# Altium schematic sheet Transform_310_310.SchDoc
size C; SheetNumber: 5; SheetTotal: 9
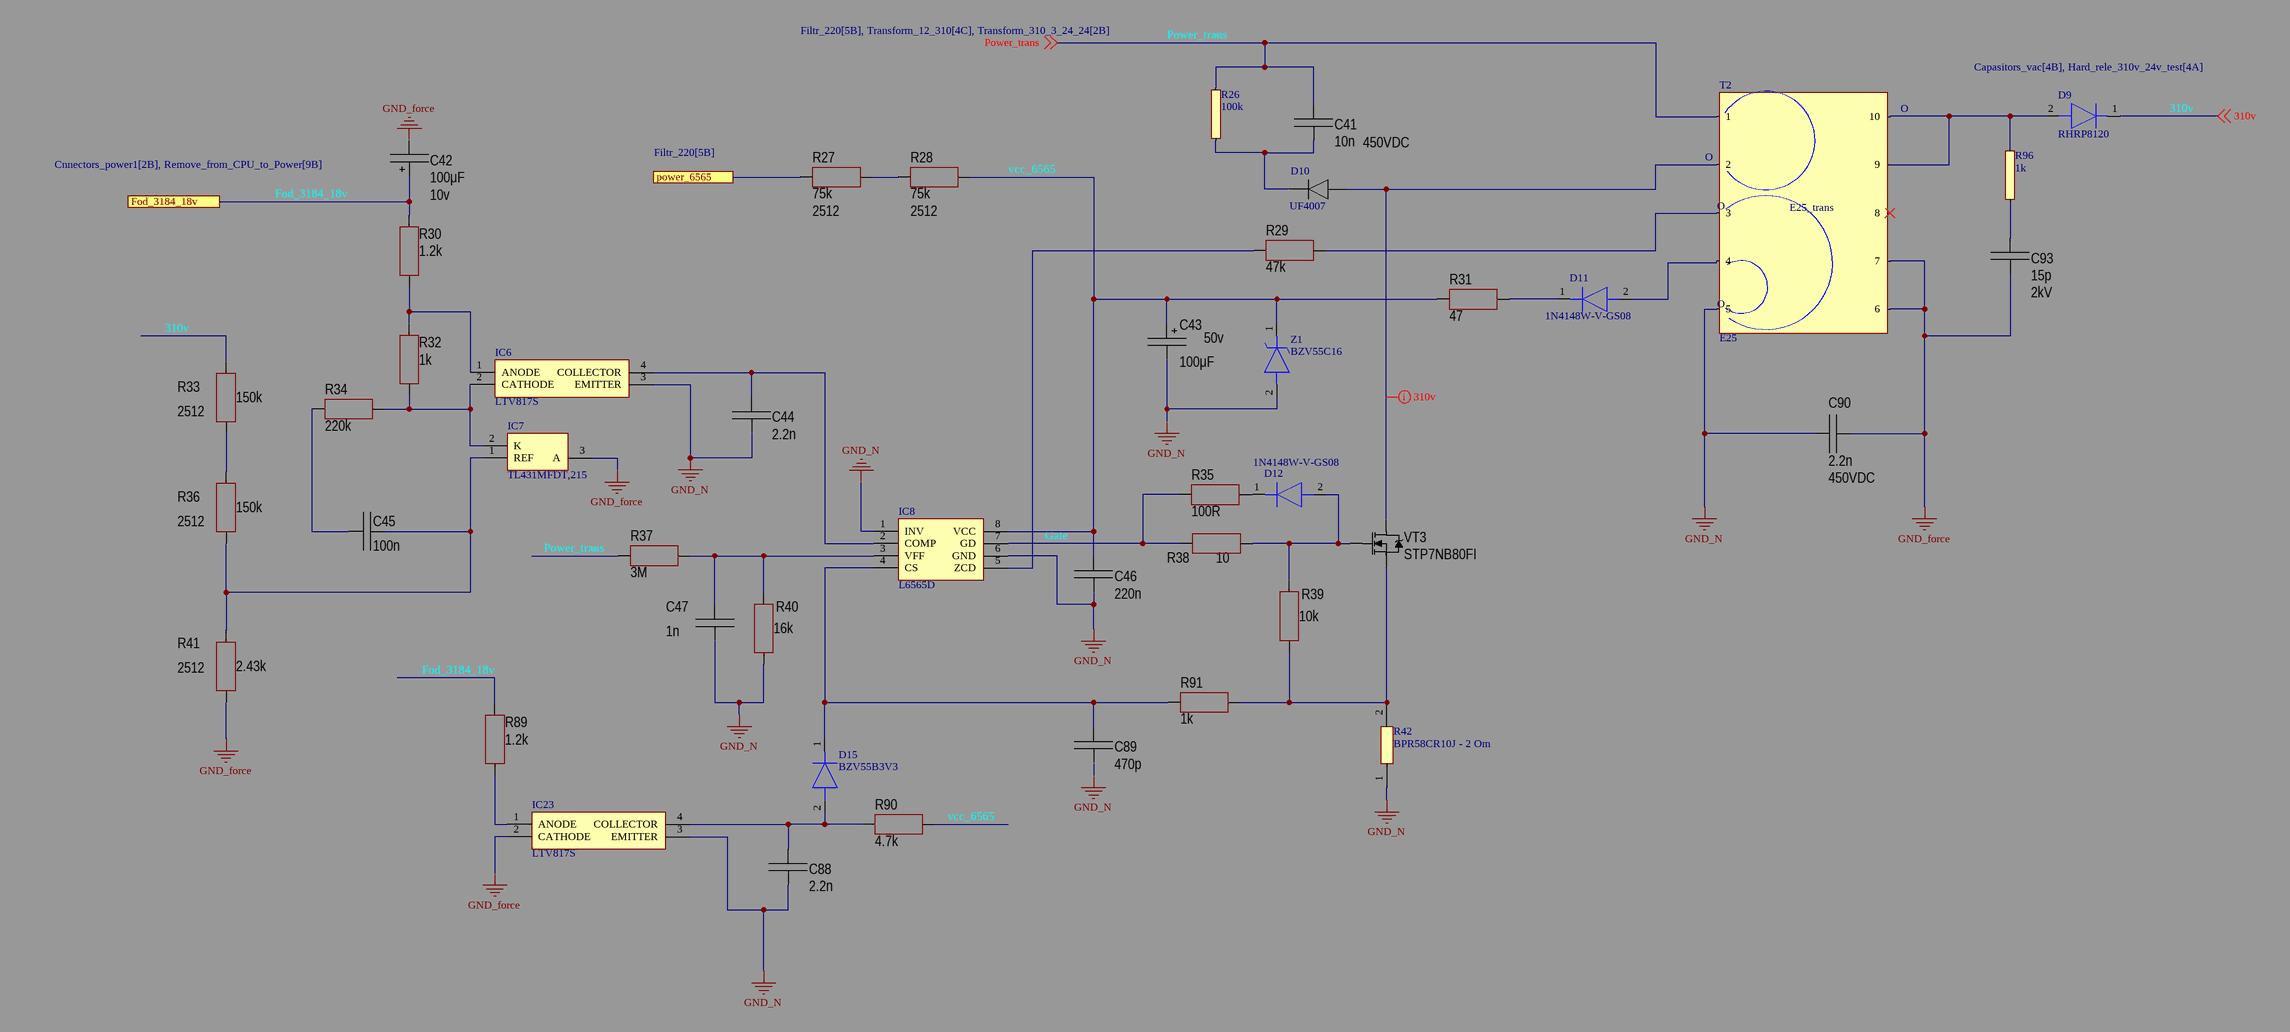
[diagram p0: Transform_310_310.SchDoc]

## Parts
C41  value 10n  Voltage: 450VDC  [CAP: AY2102M29Y5US63L7]
C42  value 100μF  Voltage: 10v  [CAP: D8C3.5H12]
C43  value 100μF  Voltage: 50v  [CAP: D8C3.5H12]
C44  value 2.2n  [CAP: 1206]
C45  value 100n  [CAP: 1206]
C46  value 220n  [CAP: 1206]
C47  value 1n  [CAP: 1206]
C88  value 2.2n  [CAP: 1206]
C89  value 470p  [CAP: 1206]
C90  value 2.2n  Voltage: 450VDC  [CAP: AY2102M29Y5US63L7]
C93  value 15p  Voltage: 2kV  [CAP: AY2102M29Y5US63L7]
D9  RHRP8120  [TO508P467X1023X1923-2P]
D10  UF4007  [THT_D_6mm_1]
D11  1N4148W-V-GS08  [1N4148WVGS08]
D12  1N4148W-V-GS08  [1N4148WVGS08]
D15  BZV55B3V3  [BZV55B3V3]
IC6  LTV817S  [SOP254P1016X460-4N]
IC7  TL431MFDT,215  [SOT95P230X110-3N]
IC8  L6565D  [SOIC127P600X175-8N]
IC23  LTV817S  [SOP254P1016X460-4N]
R26  100k  [THT_R_6mm_1]
R27  value 75k  Tolerance: 2512  [RES: 2512]
R28  value 75k  Tolerance: 2512  [RES: 2512]
R29  value 47k  [RES: 1206]
R30  value 1.2k  [RES: 1206]
R31  value 47  [RES: 1206]
R32  value 1k  [RES: 1206]
R33  value 150k  Tolerance: 2512  [RES: 2512]
R34  value 220k  [RES: 1206]
R35  value 100R  [RES: 1206]
R36  value 150k  Tolerance: 2512  [RES: 2512]
R37  value 3M  [RES: 1206]
R38  value 10  [RES: 1206]
R39  value 10k  [RES: 1206]
R40  value 16k  [RES: 1206]
R41  value 2.43k  Tolerance: 2512  [RES: 2512]
R42  BPR58CR10J - 2 Om  [BPR58CR10J]
R89  value 1.2k  [RES: 1206]
R90  value 4.7k  [RES: 1206]
R91  value 1k  [RES: 1206]
R96  1k  [THT_R_6mm_1]
T2  E25  [E25]
VT3  PartNumber: STP7NB80FI  [TO220]
Z1  BZV55C16  [BZV55C18]

## Ports
Fod_3184_18v (see Cnnectors_power1[2B], Remove_from_CPU_to_Power[9B]), power_6565 (see Filtr_220[5B])

## Nets
GND_force: C42.2 C90.2 C93.1 IC7.3(A) IC23.2(CATHODE) R41.1 T2.6 T2.7
GND_N: C43.2 C44.2 C46.1 C47.2 C88.2 C89.2 C90.1 IC6.3(EMITTER) IC8.1(INV) IC8.6(GND) IC23.3(EMITTER) R40.1 R42.1 T2.5 Z1.2(A)
310v: D9.1(K) R33.2 ; off-sheet 310v
Fod_3184_18v: C42.1 R30.1 R89.1 ; port Fod_3184_18v
Gate: IC8.7(GD) R35.1 R38.1
power_6565: R27.1 ; port power_6565
Power_trans: C41.1 R26.2 R37.1 T2.1 ; off-sheet Power_trans
vcc_6565: C43.1 C46.2 IC8.8(VCC) R28.2 R31.1 R90.2 Z1.1(K)
NetC41_2: C41.2 D10.2 R26.1
NetC44_1: C44.1 IC6.4(COLLECTOR) IC8.2(COMP)
NetC45_1: C45.1 IC7.1(REF) R36.1 R41.2
NetC45_2: C45.2 R34.1
NetC47_1: C47.1 IC8.3(VFF) R37.2 R40.2
NetC88_1: C88.1 D15.2(A) IC23.4(COLLECTOR) R90.1
NetC89_1: C89.1 D15.1(K) IC8.4(CS) R91.1
NetC93_2: C93.2 R96.1
NetD9_2: D9.2(A) R96.2 T2.9 T2.10
NetD10_1: D10.1 T2.2 VT3.2(D)
NetD11_1: D11.1(K) R31.2
NetD11_2: D11.2(A) T2.4
NetD12_1: D12.1(K) R35.2
NetD12_2: D12.2(A) R38.2 R39.2 VT3.1(G)
NetIC6_1: IC6.1(ANODE) R30.2 R32.2
NetIC6_2: IC6.2(CATHODE) IC7.2(K) R32.1 R34.2
NetIC8_5: IC8.5(ZCD) R29.1
NetIC23_1: IC23.1(ANODE) R89.2
NetR27_2: R27.2 R28.1
NetR29_2: R29.2 T2.3
NetR33_1: R33.1 R36.2
NetR39_1: R39.1 R42.2 R91.2 VT3.3(S)

Not connected (* = marked no-connect by the designer): T2 8*

## Layout directives
net class 310v: NetD10_1

## Notes on the sheet
- (near T2) O
- (in symbol E25) E25_trans

## Library data of the parts
C41 = Film: Manufacturer: Epcos; PartNumber: B32774D4106K000; ValueManufacturerPartNumber: Film capacitor, 10n, 450VDC, ±10%, 10.9mOhm, 31.5x15 mm, -40...+105°C; TypeCapacitor: Film capacitor; Tolerance: ±10%; Impedance: 10.9mOhm; Package: 31.5x15 mm; HelpURL: https://www.digikey.com/products/en/capacitors/film-capacitors/62?k=&pkeyword=&sv=0&pv2097=1958&sf=0&FV=fffc01ef%2C1f140000%2Cffe0003e%2Cffec6366&quantity=1&ColumnSort=1000011&page=1&stock=1&pageSize=25; Temperature: -40...+105°C
C42 = Aluminium: Manufacturer: Wurth; PartNumber: 860080475013; ValueManufacturerPartNumber: Aluminium capacitor, 100μF, 10v, ±20%, 54mOhm, 14x10x5 mm, -55...+105°C; TypeCapacitor: Aluminium capacitor; Tolerance: ±20%; Impedance: 54mOhm; Package: 14x10x5 mm; HelpURL: https://www.digikey.com/product-detail/en/wurth-electronics-inc/860080475013/732-9029-1-ND/5728972; Temperature: -55...+105°C
C43 = Aluminium: Manufacturer: Wurth; PartNumber: 860080475013; ValueManufacturerPartNumber: Aluminium capacitor, 100μF, 50v, ±20%, 54mOhm, 14x10x5 mm, -55...+105°C; TypeCapacitor: Aluminium capacitor; Tolerance: ±20%; Impedance: 54mOhm; Package: 14x10x5 mm; HelpURL: https://www.digikey.com/product-detail/en/wurth-electronics-inc/860080475013/732-9029-1-ND/5728972; Temperature: -55...+105°C
C44 C88 = Ceramic_1206: Manufacturer: Yageo; PartNumber: CC1206KRX7R9BB104; ValueManufacturerPartNumber: Ceramic capacitor, 2.2n, X7R, ±10%, 50V, 1206, -55...+125°C; TypeCapacitor: Ceramic capacitor; Tolerance: ±10%; TypeDielectric: X7R; Voltage: 50V; Package: 1206; HelpURL: https://www.digikey.com/product-detail/en/yageo/CC1206KRX7R9BB104/311-1179-1-ND/303089; Temperature: -55...+125°C
C45 = Ceramic_1206: Manufacturer: Yageo; PartNumber: CC1206KRX7R9BB104; ValueManufacturerPartNumber: Ceramic capacitor, 100n, X7R, ±10%, 50V, 1206, -55...+125°C; TypeCapacitor: Ceramic capacitor; Tolerance: ±10%; TypeDielectric: X7R; Voltage: 50V; Package: 1206; HelpURL: https://www.digikey.com/product-detail/en/yageo/CC1206KRX7R9BB104/311-1179-1-ND/303089; Temperature: -55...+125°C
C46 = Ceramic_1206: Manufacturer: Yageo; PartNumber: CC1206KRX7R9BB104; ValueManufacturerPartNumber: Ceramic capacitor, 220n, X7R, ±10%, 50V, 1206, -55...+125°C; TypeCapacitor: Ceramic capacitor; Tolerance: ±10%; TypeDielectric: X7R; Voltage: 50V; Package: 1206; HelpURL: https://www.digikey.com/product-detail/en/yageo/CC1206KRX7R9BB104/311-1179-1-ND/303089; Temperature: -55...+125°C
C47 = Ceramic_1206: Manufacturer: Yageo; PartNumber: CC1206KRX7R9BB104; ValueManufacturerPartNumber: Ceramic capacitor, 1n, X7R, ±10%, 50V, 1206, -55...+125°C; TypeCapacitor: Ceramic capacitor; Tolerance: ±10%; TypeDielectric: X7R; Voltage: 50V; Package: 1206; HelpURL: https://www.digikey.com/product-detail/en/yageo/CC1206KRX7R9BB104/311-1179-1-ND/303089; Temperature: -55...+125°C
C89 = Ceramic_1206: Manufacturer: Yageo; PartNumber: CC1206KRX7R9BB104; ValueManufacturerPartNumber: Ceramic capacitor, 470p, X7R, ±10%, 50V, 1206, -55...+125°C; TypeCapacitor: Ceramic capacitor; Tolerance: ±10%; TypeDielectric: X7R; Voltage: 50V; Package: 1206; HelpURL: https://www.digikey.com/product-detail/en/yageo/CC1206KRX7R9BB104/311-1179-1-ND/303089; Temperature: -55...+125°C
C90 = Film: Manufacturer: Epcos; PartNumber: B32774D4106K000; ValueManufacturerPartNumber: Film capacitor, 2.2n, 450VDC, ±10%, 10.9mOhm, 31.5x15 mm, -40...+105°C; TypeCapacitor: Film capacitor; Tolerance: ±10%; Impedance: 10.9mOhm; Package: 31.5x15 mm; HelpURL: https://www.digikey.com/products/en/capacitors/film-capacitors/62?k=&pkeyword=&sv=0&pv2097=1958&sf=0&FV=fffc01ef%2C1f140000%2Cffe0003e%2Cffec6366&quantity=1&ColumnSort=1000011&page=1&stock=1&pageSize=25; Temperature: -40...+105°C
C93 = Film: Manufacturer: Epcos; PartNumber: B32774D4106K000; ValueManufacturerPartNumber: Film capacitor, 15p, 2kV, ±10%, 10.9mOhm, 31.5x15 mm, -40...+105°C; TypeCapacitor: Film capacitor; Tolerance: ±10%; Impedance: 10.9mOhm; Package: 31.5x15 mm; HelpURL: https://www.digikey.com/products/en/capacitors/film-capacitors/62?k=&pkeyword=&sv=0&pv2097=1958&sf=0&FV=fffc01ef%2C1f140000%2Cffe0003e%2Cffec6366&quantity=1&ColumnSort=1000011&page=1&stock=1&pageSize=25; Temperature: -40...+105°C
D9 = RHRP8120: Diode; Manufacturer_Name: onsemi; Datasheet Link: https://www.onsemi.com/pub/Collateral/RHRP8120-D.PDF; Height: 4.672mm; Manufacturer_Part_Number: RHRP8120; Mouser Part Number: 512-RHRP8120; Mouser Price/Stock: https://www.mouser.co.uk/ProductDetail/onsemi-Fairchild/RHRP8120?qs=UeXq8qLVREGknIOnwE%2FlEA%3D%3D; Arrow Part Number: RHRP8120; Arrow Price/Stock: https://www.arrow.com/en/products/rhrp8120/on-semiconductor
D10 = THT_D_6mm_1
D11 D12 = 1N4148W-V-GS08: Diode; Manufacturer_Name: Vishay; Datasheet Link: https://us.rs-online.com/m/d/a2789c8794cb0c42ced29f2dd8571f3c.pdf; Height: 1.35mm; Manufacturer_Part_Number: 1N4148W-V-GS08; Mouser Part Number: 625-1N4148W-V; Mouser Price/Stock: https://www.mouser.co.uk/ProductDetail/Vishay-Semiconductors/1N4148W-V-GS08?qs=TNTIDjy6APrS%2Fdgq1RSs3A%3D%3D; Arrow Part Number: 1N4148W-V-GS08; Arrow Price/Stock: https://www.arrow.com/en/products/1n4148w-v-gs08/vishay
D15 = BZV55B3V3: Diode; Manufacturer_Name: Nexperia; Datasheet Link: https://assets.nexperia.com/documents/data-sheet/BZV55_SER.pdf; Height: 1.6mm; Manufacturer_Part_Number: BZV55B3V3
IC6 IC23 = LTV817S: Integrated Circuit; Manufacturer_Name: Lite-On; Datasheet Link: https://www.arrow.com/en/products/ltv-817s/lite-on-technology; Height: 4.6mm; Manufacturer_Part_Number: LTV817S; Arrow Part Number: LTV817S; Arrow Price/Stock: https://www.arrow.com/en/products/ltv-817s/lite-on-technology
IC7 = TL431MFDT,215: Integrated Circuit; Manufacturer_Name: Nexperia; Datasheet Link: https://assets.nexperia.com/documents/data-sheet/TL431_FAM.pdf; Height: 1.1mm; Manufacturer_Part_Number: TL431MFDT,215; Mouser Part Number: 771-TL431MFDT215; Mouser Price/Stock: https://www.mouser.co.uk/ProductDetail/Nexperia/TL431MFDT215?qs=A1cBxND5mHKvFzVl3lBdcQ%3D%3D; Arrow Part Number: TL431MFDT,215; Arrow Price/Stock: https://www.arrow.com/en/products/tl431mfdt215/nexperia?utm_currency=USD&region=nac
IC8 = L6565D: Integrated Circuit; Manufacturer_Name: STMicroelectronics; Datasheet Link: https://www.st.com/resource/en/datasheet/l6565.pdf; Height: 1.75mm; Manufacturer_Part_Number: L6565D; Mouser Part Number: 511-L6565D; Mouser Price/Stock: https://www.mouser.co.uk/ProductDetail/STMicroelectronics/L6565D/?qs=sps7W%2FwBcGGH47tz0cin9g%3D%3D; Arrow Part Number: L6565D; Arrow Price/Stock: https://www.arrow.com/en/products/l6565d/stmicroelectronics
R26 R96 = THT_R_6mm_1
R27 R28 = Resistor_2512: Manufacturer: Yageo; PartNumber: RC2512JK-07100RL; ValueManufacturerPartNumber: Resistor film, 75k, 2512, 2512, 1W, -55...+125°C; TypeResistor: Resistor film; Power: 1W; Package: 2512; HelpURL: https://www.digikey.com/product-detail/en/yageo/RC2512JK-07100RL/YAG3393CT-ND/5962215; Temperature: -55...+125°C
R29 = Resistor_1206: Manufacturer: Yageo; PartNumber: RC1206JR-07100RL; ValueManufacturerPartNumber: Resistor film, 47k, ±5%, 1206, 0.25W, -55...+125°C; TypeResistor: Resistor film; Power: 0.25W; Tolerance: ±5%; Package: 1206; HelpURL: https://www.digikey.com/product-detail/en/yageo/RC1206JR-07100RL/311-100ERCT-ND/732153; Temperature: -55...+125°C
R30 R89 = Resistor_1206: Manufacturer: Yageo; PartNumber: RC1206JR-07100RL; ValueManufacturerPartNumber: Resistor film, 1.2k, ±5%, 1206, 0.25W, -55...+125°C; TypeResistor: Resistor film; Power: 0.25W; Tolerance: ±5%; Package: 1206; HelpURL: https://www.digikey.com/product-detail/en/yageo/RC1206JR-07100RL/311-100ERCT-ND/732153; Temperature: -55...+125°C
R31 = Resistor_1206: Manufacturer: Yageo; PartNumber: RC1206JR-07100RL; ValueManufacturerPartNumber: Resistor film, 47, ±5%, 1206, 0.25W, -55...+125°C; TypeResistor: Resistor film; Power: 0.25W; Tolerance: ±5%; Package: 1206; HelpURL: https://www.digikey.com/product-detail/en/yageo/RC1206JR-07100RL/311-100ERCT-ND/732153; Temperature: -55...+125°C
R32 R91 = Resistor_1206: Manufacturer: Yageo; PartNumber: RC1206JR-07100RL; ValueManufacturerPartNumber: Resistor film, 1k, ±5%, 1206, 0.25W, -55...+125°C; TypeResistor: Resistor film; Power: 0.25W; Tolerance: ±5%; Package: 1206; HelpURL: https://www.digikey.com/product-detail/en/yageo/RC1206JR-07100RL/311-100ERCT-ND/732153; Temperature: -55...+125°C
R33 R36 = Resistor_2512: Manufacturer: Yageo; PartNumber: RC2512JK-07100RL; ValueManufacturerPartNumber: Resistor film, 150k, 2512, 2512, 1W, -55...+125°C; TypeResistor: Resistor film; Power: 1W; Package: 2512; HelpURL: https://www.digikey.com/product-detail/en/yageo/RC2512JK-07100RL/YAG3393CT-ND/5962215; Temperature: -55...+125°C
R34 = Resistor_1206: Manufacturer: Yageo; PartNumber: RC1206JR-07100RL; ValueManufacturerPartNumber: Resistor film, 220k, ±5%, 1206, 0.25W, -55...+125°C; TypeResistor: Resistor film; Power: 0.25W; Tolerance: ±5%; Package: 1206; HelpURL: https://www.digikey.com/product-detail/en/yageo/RC1206JR-07100RL/311-100ERCT-ND/732153; Temperature: -55...+125°C
R35 = Resistor_1206: Manufacturer: Yageo; PartNumber: RC1206JR-07100RL; ValueManufacturerPartNumber: Resistor film, 100R, ±5%, 1206, 0.25W, -55...+125°C; TypeResistor: Resistor film; Power: 0.25W; Tolerance: ±5%; Package: 1206; HelpURL: https://www.digikey.com/product-detail/en/yageo/RC1206JR-07100RL/311-100ERCT-ND/732153; Temperature: -55...+125°C
R37 = Resistor_1206: Manufacturer: Yageo; PartNumber: RC1206JR-07100RL; ValueManufacturerPartNumber: Resistor film, 3M, ±5%, 1206, 0.25W, -55...+125°C; TypeResistor: Resistor film; Power: 0.25W; Tolerance: ±5%; Package: 1206; HelpURL: https://www.digikey.com/product-detail/en/yageo/RC1206JR-07100RL/311-100ERCT-ND/732153; Temperature: -55...+125°C
R38 = Resistor_1206: Manufacturer: Yageo; PartNumber: RC1206JR-07100RL; ValueManufacturerPartNumber: Resistor film, 10, ±5%, 1206, 0.25W, -55...+125°C; TypeResistor: Resistor film; Power: 0.25W; Tolerance: ±5%; Package: 1206; HelpURL: https://www.digikey.com/product-detail/en/yageo/RC1206JR-07100RL/311-100ERCT-ND/732153; Temperature: -55...+125°C
R39 = Resistor_1206: Manufacturer: Yageo; PartNumber: RC1206JR-07100RL; ValueManufacturerPartNumber: Resistor film, 10k, ±5%, 1206, 0.25W, -55...+125°C; TypeResistor: Resistor film; Power: 0.25W; Tolerance: ±5%; Package: 1206; HelpURL: https://www.digikey.com/product-detail/en/yageo/RC1206JR-07100RL/311-100ERCT-ND/732153; Temperature: -55...+125°C
R40 = Resistor_1206: Manufacturer: Yageo; PartNumber: RC1206JR-07100RL; ValueManufacturerPartNumber: Resistor film, 16k, ±5%, 1206, 0.25W, -55...+125°C; TypeResistor: Resistor film; Power: 0.25W; Tolerance: ±5%; Package: 1206; HelpURL: https://www.digikey.com/product-detail/en/yageo/RC1206JR-07100RL/311-100ERCT-ND/732153; Temperature: -55...+125°C
R41 = Resistor_2512: Manufacturer: Yageo; PartNumber: RC2512JK-07100RL; ValueManufacturerPartNumber: Resistor film, 2.43k, 2512, 2512, 1W, -55...+125°C; TypeResistor: Resistor film; Power: 1W; Package: 2512; HelpURL: https://www.digikey.com/product-detail/en/yageo/RC2512JK-07100RL/YAG3393CT-ND/5962215; Temperature: -55...+125°C
R42 = BPR58CR10J: Resistor; Manufacturer_Name: KOA Speer; Datasheet Link: https://www.koaspeer.com/catimages/Products/BPR/BPR.pdf; Height: 19mm; Manufacturer_Part_Number: BPR58CR10J; Mouser Part Number: 660-BPR58CR10J; Mouser Price/Stock: https://www.mouser.co.uk/ProductDetail/KOA-Speer/BPR58CR10J?qs=c3C3yipULq1EyCkbnj3nTQ%3D%3D; Arrow Part Number: BPR58CR10J; Arrow Price/Stock: https://www.arrow.com/en/products/bpr58cr10j/koa-speer-electronics.html?utm_currency=USD&region=nac
R90 = Resistor_1206: Manufacturer: Yageo; PartNumber: RC1206JR-07100RL; ValueManufacturerPartNumber: Resistor film, 4.7k, ±5%, 1206, 0.25W, -55...+125°C; TypeResistor: Resistor film; Power: 0.25W; Tolerance: ±5%; Package: 1206; HelpURL: https://www.digikey.com/product-detail/en/yageo/RC1206JR-07100RL/311-100ERCT-ND/732153; Temperature: -55...+125°C
VT3 = MOSFET_N_123: Manufacturer: Infineon Technologies; ValueManufacturerPartNumber: MOSFET N-channel transistor, 80V, 7A, 9.1nC, 2.5W, 34mOhm, 756pF, 8-TDSON, -55...+150°C; TypeTransistor: MOSFET N-channel transistor; VoltageDS: 80V; CurrentDS: 7A; RDS: 34mOhm; GateCharge: 9.1nC; InputCapacitor: 756pF; MaxPower: 2.5W; Package: 8-TDSON; HelpURL: https://www.digikey.com/product-detail/en/infineon-technologies/BSC340N08NS3GATMA1/BSC340N08NS3GATMA1TR-ND/2080655; Temperature: -55...+150°C
Z1 = BZV55C18: Zener Diode; Manufacturer_Name: Microchip; Datasheet Link: https://www.microsemi.com/document-portal/doc_download/8298-bzv55-c2v4-c75-datasheet; Height: 1.7mm; Manufacturer_Part_Number: BZV55C18; Mouser Part Number: 494-BZV55C18; Mouser Price/Stock: https://www.mouser.co.uk/ProductDetail/Microchip-Technology/BZV55C18?qs=w%2Fv1CP2dgqosS2q5rh%252BhPQ%3D%3D; Arrow Part Number: BZV55C18; Arrow Price/Stock: https://www.arrow.com/en/products/bzv55c18/microchip-technology.html?utm_currency=USD&region=nac